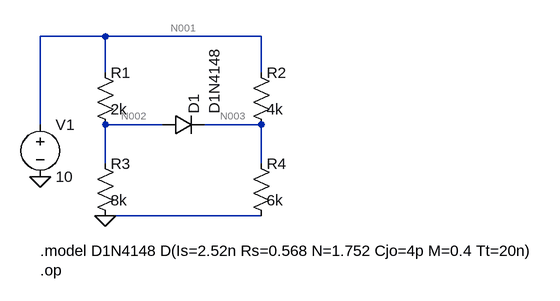
[diagram p0: schematic Ex04.asc]
Ex04.asc, the LTspice schematic file:
Version 4
SHEET 1 880 680
WIRE 80 216 80 80
WIRE 80 80 180 80
WIRE 180 80 180 136
WIRE 180 80 420 80
WIRE 420 80 420 136
WIRE 180 216 180 276
WIRE 420 216 420 276
WIRE 180 216 268 216
WIRE 332 216 420 216
WIRE 180 356 420 356
FLAG 80 296 0
FLAG 180 356 0
SYMBOL voltage 80 200 R0
WINDOW 0 24 16 Left 2
WINDOW 3 24 96 Left 2
SYMATTR InstName V1
SYMATTR Value 10
SYMBOL res 164 120 R0
WINDOW 0 24 16 Left 2
WINDOW 3 24 72 Left 2
SYMATTR InstName R1
SYMATTR Value 2k
SYMBOL res 404 120 R0
WINDOW 0 24 16 Left 2
WINDOW 3 24 72 Left 2
SYMATTR InstName R2
SYMATTR Value 4k
SYMBOL diode 268 232 R270
WINDOW 0 32 48 Left 2
WINDOW 3 32 80 Left 2
SYMATTR InstName D1
SYMATTR Value D1N4148
SYMBOL res 164 260 R0
WINDOW 0 24 16 Left 2
WINDOW 3 24 72 Left 2
SYMATTR InstName R3
SYMATTR Value 8k
SYMBOL res 404 260 R0
WINDOW 0 24 16 Left 2
WINDOW 3 24 72 Left 2
SYMATTR InstName R4
SYMATTR Value 6k
TEXT 80 410 Left 2 !.model D1N4148 D(Is=2.52n Rs=0.568 N=1.752 Cjo=4p M=0.4 Tt=20n)
TEXT 80 440 Left 2 !.op

The netlist it stands for:
* Ex04.asc
V1 N001 0 10
R1 N001 N002 2k
R2 N001 N003 4k
D1 N002 N003 D1N4148
R3 N002 0 8k
R4 N003 0 6k
.model D D
.lib standard.dio
.model D1N4148 D(Is=2.52n Rs=0.568 N=1.752 Cjo=4p M=0.4 Tt=20n)
.op
.backanno
.end

* Results of the author's LTspice run, read from the files saved beside the schematic
* Operating Point:
*   V(n001) = 10 V
*   V(n002) = 7.415 V
*   V(n003) = 6.877 V
*   I(D1) = 365.3 µA
*   I(R1) = 1.292 mA
*   I(R2) = 780.8 µA
*   I(R3) = 926.9 µA
*   I(R4) = 1.146 mA
*   I(V1) = -2.073 mA